# EasyEDA Pro project honglin-first_crt_smartphone-e4cb491d.epro, board 键盘
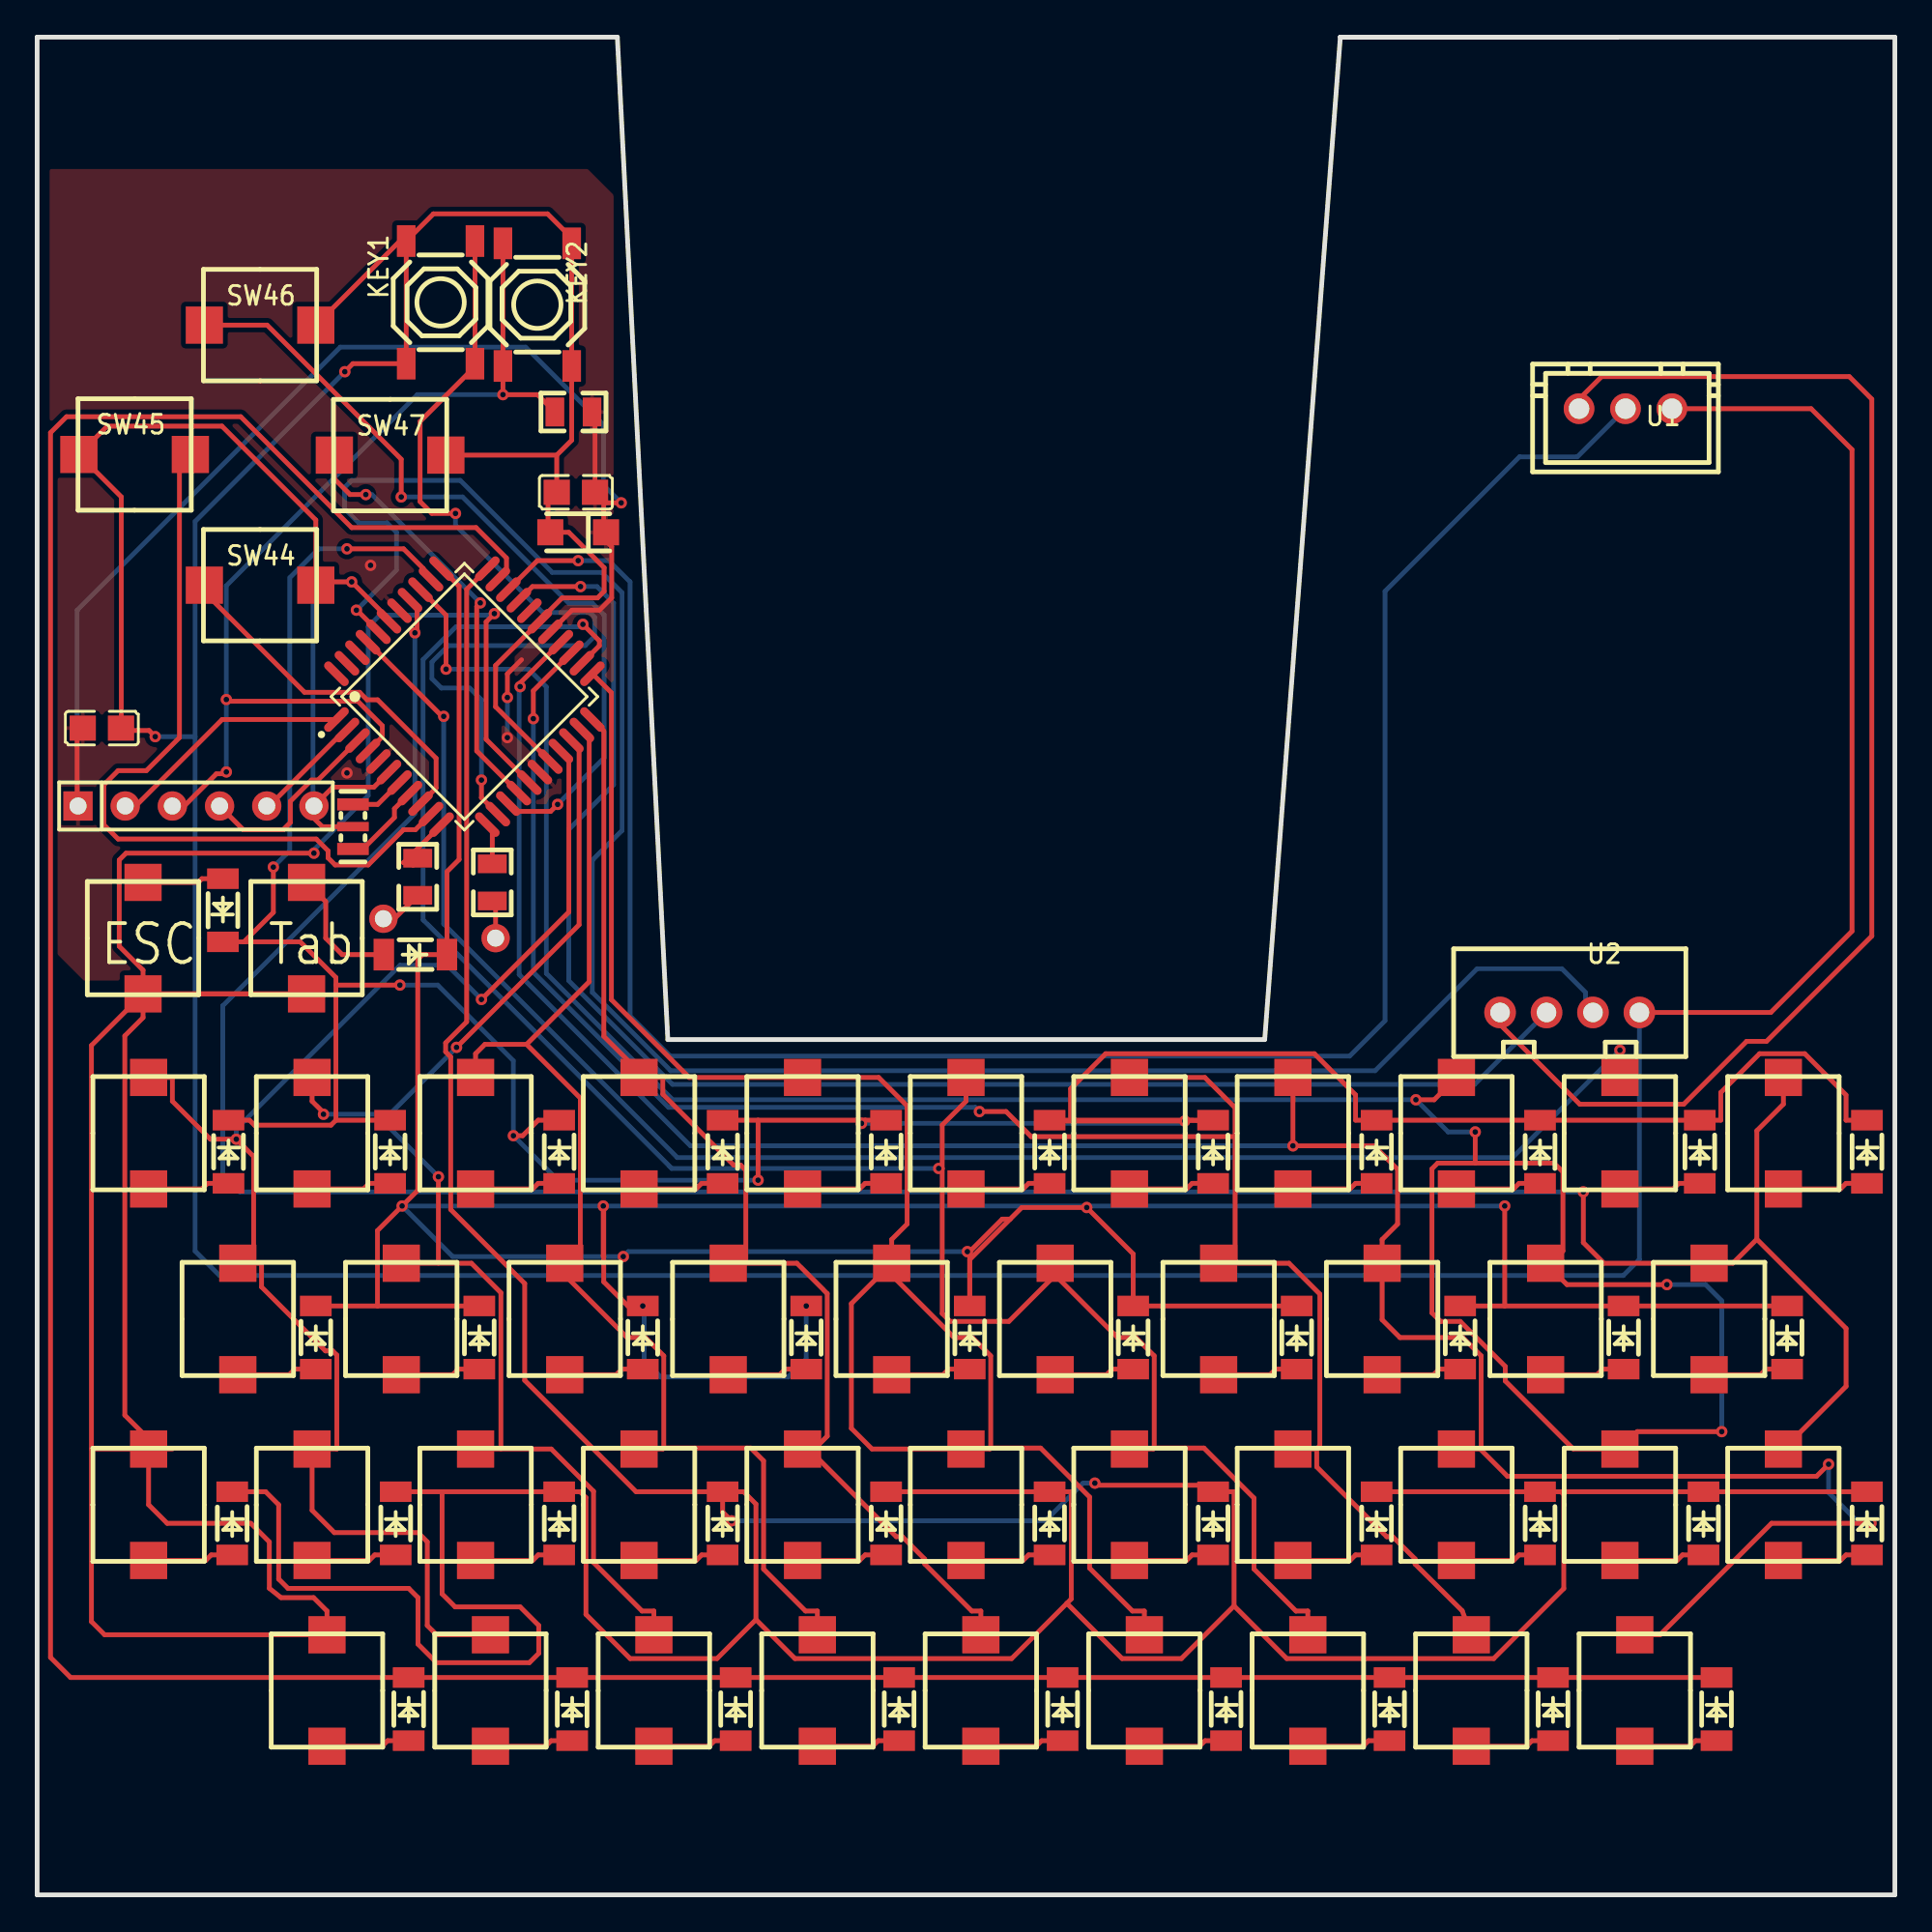
[diagram p9: board, top side]
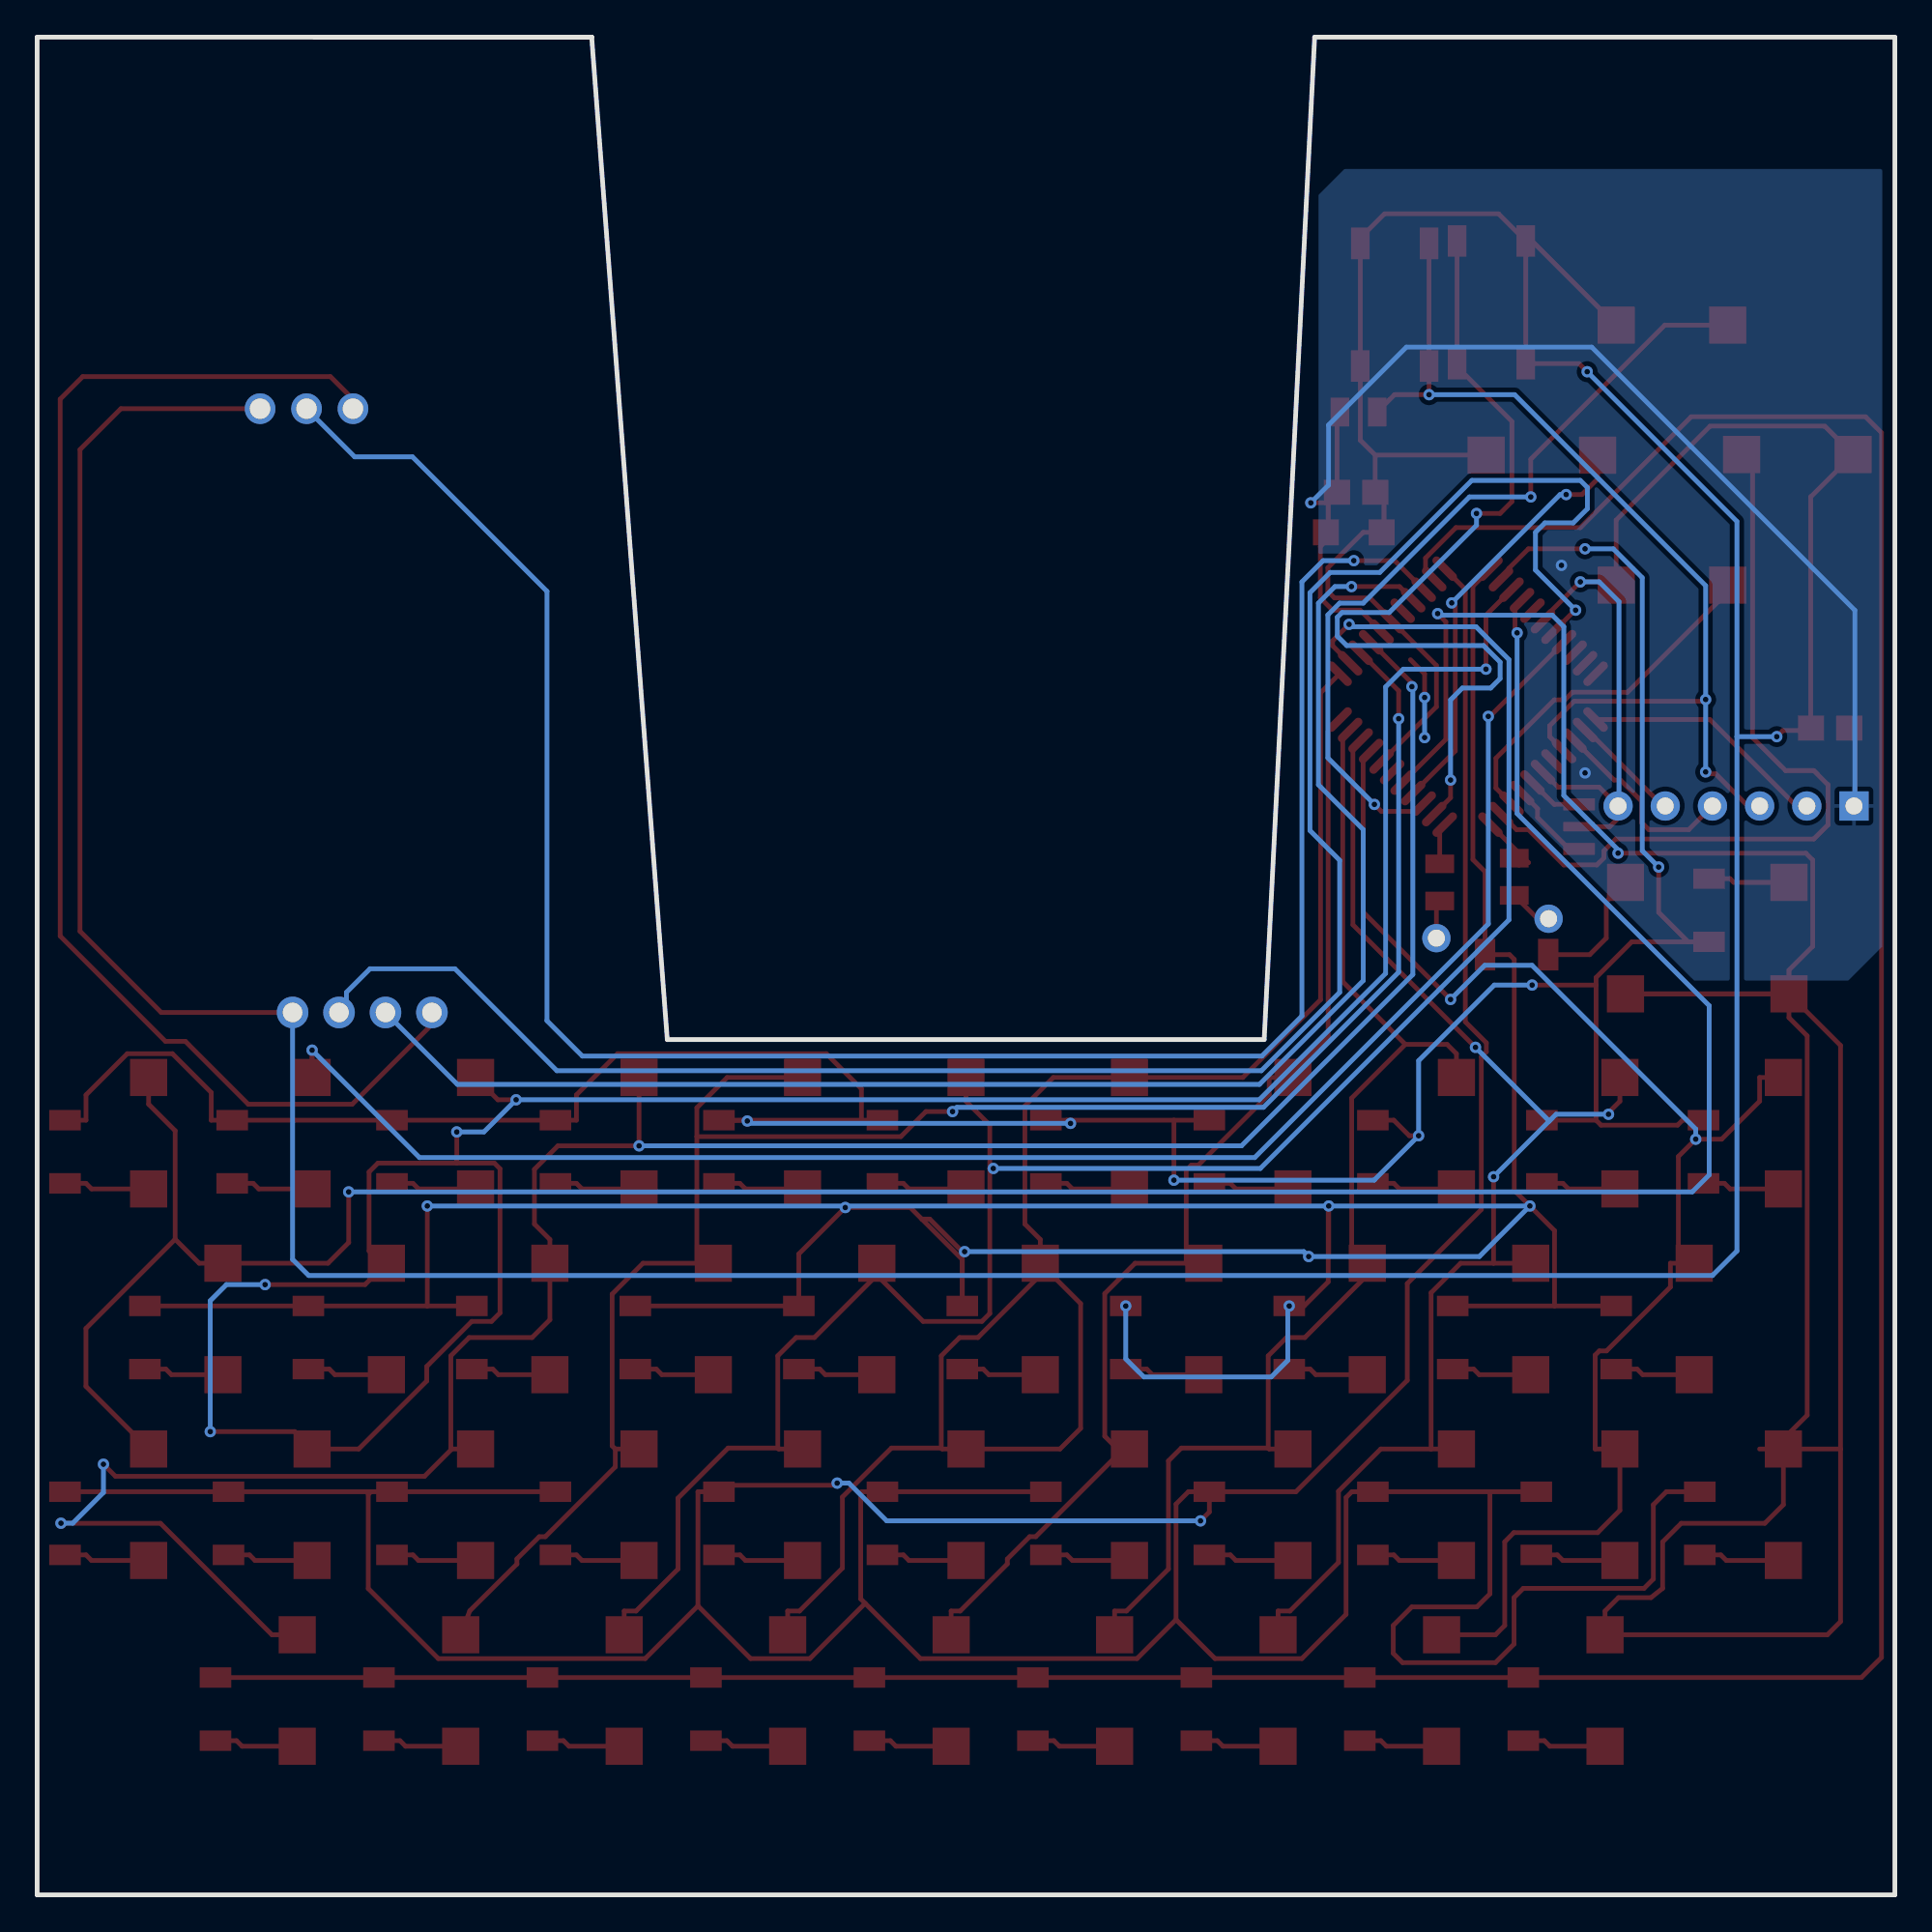
[diagram p10: board, bottom side, seen from below]

Outline 100 x 100 mm; copper layers: Top Layer, Bottom Layer. Coordinates in mm from the lower left corner of the outline.
Outline path: 70.15,100 66.08,46.04 33.95,46.04 31.23,100 0,100 0,0 100,0 100,100 70.15,100 ; 70.15,100 85.08,100 70.15,100
Stack: Top Layer 0.035mm / Dielectric1 1.51mm FR4 er 4.5 / Bottom Layer 0.035mm

## Design rules (mm)
spacing safeClearance (default): track to track 0.152, other pairs 0.152 to 0.3
spacing Plane_innerPlane: track to track 0.152, other pairs 0.152 to 0.3
spacing Copper_copperRegion: track to track 0.152, other pairs 0.152 to 0.3
track width trackWidth (default): min 0.127, default 0.254, max 2.54
differential pair differentialPair (default): width min 0.127, default 0.254, max 2.54; gap min 0.152, default 0.152
pour e943 uses Copper_copperRegion
pour e976 uses Copper_copperRegion

## Placement (name value [footprint] x y rotation side)
C10  4.7uF  [CAP-SMD_L3.2-W1.6-R-RD]  29.12 73.34 0 top
C11  0.1uF  [C0805]  3.48 62.8 180 top
C12  0.1uF  [C0805]  29 75.5 0 top
D1  1n4148  [LL-34_L3.5-W1.5-RD01]  10 53 90 top
D2  1n4148  [LL-34_L3.5-W1.5-RD01]  10.3 40 270 top
D3  1n4148  [LL-34_L3.5-W1.5-RD01]  19 40 270 top
D4  1n4148  [LL-34_L3.5-W1.5-RD01]  28.1 40 270 top
D5  1n4148  [LL-34_L3.5-W1.5-RD01]  36.9 40 270 top
D6  1n4148  [LL-34_L3.5-W1.5-RD01]  45.7 40 270 top
D7  1n4148  [LL-34_L3.5-W1.5-RD01]  54.5 40 270 top
D8  1n4148  [LL-34_L3.5-W1.5-RD01]  63.3 40 270 top
D9  1n4148  [LL-34_L3.5-W1.5-RD01]  72.1 40 270 top
D10  1n4148  [LL-34_L3.5-W1.5-RD01]  80.9 40 270 top
D11  1n4148  [LL-34_L3.5-W1.5-RD01]  20.36 50.61 180 top
D12  1n4148  [LL-34_L3.5-W1.5-RD01]  15 30 270 top
D13  1n4148  [LL-34_L3.5-W1.5-RD01]  23.8 30 270 top
D14  1n4148  [LL-34_L3.5-W1.5-RD01]  32.6 30 270 top
D15  1n4148  [LL-34_L3.5-W1.5-RD01]  41.4 30 270 top
D16  1n4148  [LL-34_L3.5-W1.5-RD01]  50.2 30 270 top
D17  1n4148  [LL-34_L3.5-W1.5-RD01]  59 30 270 top
D18  1n4148  [LL-34_L3.5-W1.5-RD01]  67.8 30 270 top
D19  1n4148  [LL-34_L3.5-W1.5-RD01]  76.6 30 270 top
D20  1n4148  [LL-34_L3.5-W1.5-RD01]  85.4 30 270 top
D21  1n4148  [LL-34_L3.5-W1.5-RD01]  10.5 20 270 top
D22  1n4148  [LL-34_L3.5-W1.5-RD01]  19.3 20 270 top
D23  1n4148  [LL-34_L3.5-W1.5-RD01]  28.1 20 270 top
D24  1n4148  [LL-34_L3.5-W1.5-RD01]  36.9 20 270 top
D25  1n4148  [LL-34_L3.5-W1.5-RD01]  45.7 20 270 top
D26  1n4148  [LL-34_L3.5-W1.5-RD01]  54.5 20 270 top
D27  1n4148  [LL-34_L3.5-W1.5-RD01]  63.3 20 270 top
D28  1n4148  [LL-34_L3.5-W1.5-RD01]  72.1 20 270 top
D29  1n4148  [LL-34_L3.5-W1.5-RD01]  80.9 20 270 top
D30  1n4148  [LL-34_L3.5-W1.5-RD01]  89.7 20 270 top
D31  1n4148  [LL-34_L3.5-W1.5-RD01]  20 10 270 top
D32  1n4148  [LL-34_L3.5-W1.5-RD01]  28.8 10 270 top
D33  1n4148  [LL-34_L3.5-W1.5-RD01]  37.6 10 270 top
D34  1n4148  [LL-34_L3.5-W1.5-RD01]  46.4 10 270 top
D35  1n4148  [LL-34_L3.5-W1.5-RD01]  55.2 10 270 top
D36  1n4148  [LL-34_L3.5-W1.5-RD01]  64 10 270 top
D37  1n4148  [LL-34_L3.5-W1.5-RD01]  72.8 10 270 top
D38  1n4148  [LL-34_L3.5-W1.5-RD01]  81.6 10 270 top
D39  1n4148  [LL-34_L3.5-W1.5-RD01]  90.4 10 270 top
D40  1n4148  [LL-34_L3.5-W1.5-RD01]  98.5 40 270 top
D41  1n4148  [LL-34_L3.5-W1.5-RD01]  94.2 30 270 top
D42  1n4148  [LL-34_L3.5-W1.5-RD01]  98.5 20 270 top
D43  1n4148  [LL-34_L3.5-W1.5-RD01]  89.5 40 270 top
IC1  ATMEGA32A-AU  [TQFP-44_L10.0-W10.0-P0.80-LS12.0-BL]  23 64.5 315 top
J3  Pin06  [PIN06]  8.55 58.61 90 top
KEY1  Key-4P  [SW-SMD_4P-L5.1-W5.1-P3.70-LS6.5-TL-2]  21.72 85.72 90 top
KEY2  Key-4P  [SW-SMD_4P-L5.1-W5.1-P3.70-LS6.5-TL-2]  26.92 85.6 270 top
NOREF  -  [Pad_e62]  18.64 52.54 0 top
NOREF#2  -  [Pad_e63]  24.68 51.5 0 top
R3  10K  [R0805]  28.87 79.82 0 top
R8  68R  [R0805]  20.49 54.8 90 top
R9  68R  [R0805]  24.5 54.5 90 top
SW1  KB01  [6*6*5硅胶开关]  5.7 51.5 270 top
SW2  KB01  [6*6*5硅胶开关]  6 41 90 top
SW3  KB01  [6*6*5硅胶开关]  14.8 41 90 top
SW4  KB01  [6*6*5硅胶开关]  23.6 41 90 top
SW5  KB01  [6*6*5硅胶开关]  32.4 41 90 top
SW6  KB01  [6*6*5硅胶开关]  41.2 41 90 top
SW7  KB01  [6*6*5硅胶开关]  50 41 90 top
SW8  KB01  [6*6*5硅胶开关]  58.8 41 90 top
SW9  KB01  [6*6*5硅胶开关]  67.6 41 90 top
SW10  KB01  [6*6*5硅胶开关]  76.4 41 90 top
SW11  KB01  [6*6*5硅胶开关]  14.5 51.5 270 top
SW12  KB01  [6*6*5硅胶开关]  10.8 31 90 top
SW13  KB01  [6*6*5硅胶开关]  19.6 31 90 top
SW14  KB01  [6*6*5硅胶开关]  28.4 31 90 top
SW15  KB01  [6*6*5硅胶开关]  37.2 31 90 top
SW16  KB01  [6*6*5硅胶开关]  46 31 90 top
SW17  KB01  [6*6*5硅胶开关]  54.8 31 90 top
SW18  KB01  [6*6*5硅胶开关]  63.6 31 90 top
SW19  KB01  [6*6*5硅胶开关]  72.4 31 90 top
SW20  KB01  [6*6*5硅胶开关]  81.2 31 90 top
SW21  KB01  [6*6*5硅胶开关]  6 21 90 top
SW22  KB01  [6*6*5硅胶开关]  14.8 21 90 top
SW23  KB01  [6*6*5硅胶开关]  23.6 21 90 top
SW24  KB01  [6*6*5硅胶开关]  32.4 21 90 top
SW25  KB01  [6*6*5硅胶开关]  41.2 21 90 top
SW26  KB01  [6*6*5硅胶开关]  50 21 90 top
SW27  KB01  [6*6*5硅胶开关]  58.8 21 90 top
SW28  KB01  [6*6*5硅胶开关]  67.6 21 90 top
SW29  KB01  [6*6*5硅胶开关]  76.4 21 90 top
SW30  KB01  [6*6*5硅胶开关]  85.2 21 90 top
SW31  KB01  [6*6*5硅胶开关]  15.6 11 90 top
SW32  KB01  [6*6*5硅胶开关]  24.4 11 90 top
SW33  KB01  [6*6*5硅胶开关]  33.2 11 90 top
SW34  KB01  [6*6*5硅胶开关]  42 11 90 top
SW35  KB01  [6*6*5硅胶开关]  50.8 11 90 top
SW36  KB01  [6*6*5硅胶开关]  59.6 11 90 top
SW37  KB01  [6*6*5硅胶开关]  68.4 11 90 top
SW38  KB01  [6*6*5硅胶开关]  77.2 11 90 top
SW39  KB01  [6*6*5硅胶开关]  86 11 90 top
SW40  KB01  [6*6*5硅胶开关]  85.2 41 90 top
SW41  KB01  [6*6*5硅胶开关]  94 41 90 top
SW42  KB01  [6*6*5硅胶开关]  90 31 90 top
SW43  KB01  [6*6*5硅胶开关]  94 21 90 top
SW44  KB01  [6*6*5硅胶开关]  12 70.5 0 top
SW45  KB01  [6*6*5硅胶开关]  5.25 77.54 180 top
SW46  KB01  [6*6*5硅胶开关]  12 84.5 0 top
SW47  KB01  [6*6*5硅胶开关]  19 77.5 0 top
U1  XH2.54-3P 直插  [CONN-TH_XH2.54-3P]  85.5 80 0 top
U2  XH2.54_4P_直插  [CONN-TH_4P-P2.50-XH2.54-4P]  82.5 47.5 180 top
X1  16MHz  [OSC-SMD_3P-L3.2-W1.3-P1.2-L]  17 57.5 90 top

## Footprints (pads in the part's own frame, mm; a bottom-side part is the same pattern mirrored in y, then rotated)
6*6*5硅胶开关
  rect 2x2 smd: 1(-3,0) 2(3,0)
C0805
  rect 1.41x1.35 smd: 1(-1.03,0) 2(1.03,0)
CAP-SMD_L3.2-W1.6-R-RD
  rect 1.4x1.4 smd: 1(1.5,0) 2(-1.5,0)
CONN-TH_4P-P2.50-XH2.54-4P
  round 1.7 hole 1.05: 1(3.75,0) 2(1.25,0) 3(-1.25,0) 4(-3.75,0)
CONN-TH_XH2.54-3P
  round 1.65 hole 1.1: 1(-2.5,0) 2(0,0) 3(2.5,0)
LL-34_L3.5-W1.5-RD01
  rect 1.1x1.7 smd: 1(1.7,0) 2(-1.7,0)
OSC-SMD_3P-L3.2-W1.3-P1.2-L
  rect 0.65x1.7 smd: 1(-1.2,0) 3(1.2,0)
  rect 0.5x1.7 smd: 2(0,0)
Pad_e62
  round 1.524 hole 0.914: 1(0,0)
Pad_e63
  round 1.524 hole 0.914: 1(0,0)
PIN06
  rect 1.575x1.575 hole 0.914: 1(0,6.35)
  round 1.575 hole 0.914: 2(0,3.81) 3(0,1.27) 4(0,-1.27) 5(0,-3.81) 6(0,-6.35)
R0805
  rect 1x1.55 smd: 1(-1,0) 2(1,0)
SW-SMD_4P-L5.1-W5.1-P3.70-LS6.5-TL-2
  rect 1.7x1 smd: 1(-3.3,1.849) 2(3.3,1.851) 3(-3.3,-1.851) 4(3.3,-1.851)
TQFP-44_L10.0-W10.0-P0.80-LS12.0-BL
  oval 0.448x1.684 smd: 1(-4,-5.742) 2(-3.2,-5.742) 3(-2.4,-5.742) 4(-1.6,-5.742) 5(-0.8,-5.742) 6(0,-5.742) 7(0.8,-5.742) 8(1.6,-5.742) 9(2.4,-5.742) 10(3.2,-5.742) 11(4,-5.742) 23(4,5.742) 24(3.2,5.742) 25(2.4,5.742) 26(1.6,5.742) 27(0.8,5.742) 28(0,5.742) 29(-0.8,5.742) 30(-1.6,5.742) 31(-2.4,5.742) 32(-3.2,5.742) 33(-4,5.742)
  oval 1.684x0.448 smd: 12(5.742,-4) 13(5.742,-3.2) 14(5.742,-2.4) 15(5.742,-1.6) 16(5.742,-0.8) 17(5.742,0) 18(5.742,0.8) 19(5.742,1.6) 20(5.742,2.4) 21(5.742,3.2) 22(5.742,4) 34(-5.742,4) 35(-5.742,3.2) 36(-5.742,2.4) 37(-5.742,1.6) 38(-5.742,0.8) 39(-5.742,0) 40(-5.742,-0.8) 41(-5.742,-1.6) 42(-5.742,-2.4) 43(-5.742,-3.2) 44(-5.742,-4)

## Nets
GND: C10.2 C11.1 C12.1 IC1.6 IC1.18 IC1.28 IC1.39 J3.6 KEY1.1 KEY1.2 KEY2.1 KEY2.2 SW44.2 SW45.2 SW46.2 SW47.2 U1.3 U2.4 X1.2
VCC: C10.1 C11.2 C12.2 IC1.5 IC1.17 IC1.27 IC1.38 J3.1 R3.2
B1: IC1.40 U2.3
BLDO2: U1.1 U2.1
COL1: IC1.9 SW44.1
COL2: IC1.10 SW45.1
COL3: IC1.14 SW46.1
COL4: IC1.15 SW47.1
COL5: IC1.16 SW1.2 SW11.2 SW21.2 SW31.2
COL6: IC1.19 SW2.2 SW12.2 SW22.2 SW32.2
COL7: IC1.20 SW3.2 SW13.2 SW23.2 SW33.2
COL8: IC1.21 SW4.2 SW14.2 SW24.2 SW34.2
COL9: IC1.22 SW5.2 SW15.2 SW25.2 SW35.2
COL10: IC1.23 SW6.2 SW16.2 SW26.2 SW36.2
COL11: IC1.24 SW7.2 SW17.2 SW27.2 SW37.2
COL12: IC1.25 SW8.2 SW18.2 SW28.2 SW38.2
COL13: IC1.26 SW9.2 SW19.2 SW29.2 SW39.2
COL14: IC1.36 SW10.2 SW20.2 SW30.2
COL15: IC1.37 SW41.2 SW42.2 SW43.2
COL16: IC1.41 SW40.2
D+: IC1.11 R8.2
D-: IC1.12 R9.2
MISO: IC1.2 J3.5
MOSI: IC1.1 J3.2
PRX: IC1.30 U2.2
PRY: IC1.31 U1.2
ROW1: D1.2 D2.2 D3.2 D4.2 D5.2 D6.2 D7.2 D8.2 D9.2 D10.2 D40.2 D43.2 IC1.35
ROW2: D11.2 D12.2 D13.2 D14.2 D15.2 D16.2 D17.2 D18.2 D19.2 D20.2 D41.2 IC1.34
ROW3: D21.2 D22.2 D23.2 D24.2 D25.2 D26.2 D27.2 D28.2 D29.2 D30.2 D42.2 IC1.33
ROW4: D31.2 D32.2 D33.2 D34.2 D35.2 D36.2 D37.2 D38.2 D39.2 IC1.32
RST: IC1.4 J3.3 KEY2.3 KEY2.4 R3.1
SCK: IC1.3 J3.4
USB_KEYBOARD_D+: NOREF.1 R8.1
USB_KEYBOARD_D-: NOREF#2.1 R9.1
$2N1011: IC1.8 X1.1
$2N1012: IC1.7 X1.3
$2N1154: IC1.13 KEY1.3 KEY1.4
$2N1512: D1.1 SW1.1
$2N1513: D2.1 SW2.1
$2N1514: D3.1 SW3.1
$2N1515: D4.1 SW4.1
$2N1516: D5.1 SW5.1
$2N1517: D6.1 SW6.1
$2N1518: D7.1 SW7.1
$2N1519: D8.1 SW8.1
$2N1520: D9.1 SW9.1
$2N1521: D10.1 SW10.1
$2N1522: D11.1 SW11.1
$2N1523: D12.1 SW12.1
$2N1524: D13.1 SW13.1
$2N1525: D14.1 SW14.1
$2N1526: D15.1 SW15.1
$2N1527: D16.1 SW16.1
$2N1528: D17.1 SW17.1
$2N1529: D18.1 SW18.1
$2N1530: D19.1 SW19.1
$2N1531: D20.1 SW20.1
$2N1532: D21.1 SW21.1
$2N1533: D22.1 SW22.1
$2N1534: D23.1 SW23.1
$2N1535: D24.1 SW24.1
$2N1536: D25.1 SW25.1
$2N1537: D26.1 SW26.1
$2N1538: D27.1 SW27.1
$2N1539: D28.1 SW28.1
$2N1540: D29.1 SW29.1
$2N1541: D30.1 SW30.1
$2N1542: D31.1 SW31.1
$2N1543: D32.1 SW32.1
$2N1544: D33.1 SW33.1
$2N1545: D34.1 SW34.1
$2N1546: D35.1 SW35.1
$2N1547: D36.1 SW36.1
$2N1548: D37.1 SW37.1
$2N1549: D38.1 SW38.1
$2N1550: D39.1 SW39.1
$2N1551: D40.1 SW41.1
$2N1552: D41.1 SW42.1
$2N1553: D42.1 SW43.1
$2N1554: D43.1 SW40.1

Pads without a net: IC1 29 42 43 44

## Via types
v1: diameter 0.61, hole 0.305, Top Layer to Bottom Layer, 61 vias

## Routing (per net, layer and track width the routed paths; a pad name or vN(x,y) marks a point on that pad's centre or on a via; arc(x,y) is an arc through that point)
GND: length 326
  Top Layer w0.254: 27.97,77.5 C12.1 27.5,75.03 27.5,73 ; 27.97,77.5 28.77,78.3 KEY2.2 ; 27.97,77.5 SW47.2 ; 19.87,89.02 KEY1.1 17,82.42 v1(16.56,81.99) ; X1.2 15.35,57.5 14.85,58 ; v1(6.36,62.35) 6.03,62.68 4.53,62.68 4.53,75.25 SW45.2 3.77,79.06 9.95,79.06 15,74.01 SW44.2 15.18,70.68 v1(16.93,70.68) 18.94,68.67 18.94,68.56 ; 28.77,82.3 28.77,89.19 27.47,90.49 21.33,90.49 KEY1.2 19.53,89.02 SW46.2 ; IC1.18 24.68,63.95 24.68,66.18 27.06,68.56 27.06,68.61 28.26,69.81 30.16,69.81 30.52,70.17 30.52,71.44 28.61,73.34 C10.2 ; U2.4 93.32,47.5 97.69,51.87 97.69,77.8 95.49,80 U1.3 ; IC1.6 18.13,59.63 15.92,59.63 J3.6
  Bottom Layer w0.254: 14.85,58 14.85,69.61 15.92,70.68 v1(16.93,70.68) ; v1(16.56,81.99) 8.5,73.93 8.5,62.35 ; 8.5,62.35 v1(6.36,62.35) ; 8.5,62.35 8.5,34.66 9.82,33.34 85.38,33.34 86.25,34.21 U2.4
VCC: length 76.7
  Top Layer w0.254: v1(25.31,64.45) 25.31,65.72 26.08,66.49 ; IC1.27 28.79,69.15 30.27,69.15 30.93,69.81 30.93,72.57 30.5,73 30.5,74.93 ; R3.2 30.03,79.66 C12.2 30.03,75.4 30.5,74.93 ; 30.5,74.93 v1(31.44,74.93) ; 2.15,58 2.15,62.63 2.47,62.95
  Bottom Layer w0.254: v1(25.31,62.3) v1(25.31,64.45) ; 2.15,58 2.15,69.15 16.32,83.31 26.29,83.31 30.48,79.12 30.48,75.89 v1(31.44,74.93)
  vias: v1(16.68,60.39) v1(17.95,71.57)
B1: length 110.2
  Top Layer w0.254: IC1.40 17.21,69.15 v1(17.19,69.15)
  Bottom Layer w0.254: U2.3 83.35,47.9 83.35,48.58 82.08,49.85 77.51,49.85 72.02,44.36 34.1,44.36 29.89,48.58 29.89,55.69 31.48,57.29 31.48,70.09 30.39,71.19 27.73,71.19 22.77,76.14 16.93,76.14 16.55,75.76 16.55,74.61 17.31,73.85 18.84,73.85 19.34,73.34 19.34,71.31 v1(17.19,69.15)
BLDO2: length 72.4
  Top Layer w0.254: U1.1 83,80.51 84.21,81.73 97.55,81.73 98.76,80.51 98.76,51.61 93.09,45.94 92.02,45.94 88.63,42.56 83.04,42.56 78.75,46.85 U2.1
COL1: length 19.3
  Top Layer w0.254: SW44.1 9,70.13 14.39,64.73 17.35,64.73 17.76,64.33 18.33,64.33 21.48,61.18 21.48,59.58 IC1.9
COL2: length 42.6
  Top Layer w0.254: IC1.10 20.36,57.34 19.72,57.34 17.82,55.44 16.04,55.44 15.66,55.82 15.66,56.2 15.03,56.83 4.36,56.83 3.6,57.6 3.6,59.76 4.36,60.52 5.88,60.52 7.66,62.3 7.66,76.95 SW45.1
COL3: length 43.4
  Top Layer w0.254: IC1.14 25.78,58.32 27.64,58.32 v1(28.02,58.7) ; v1(19.6,75.25) 19.6,77.28 12.38,84.5 SW46.1
  Bottom Layer w0.254: v1(19.6,75.25) 22.9,75.25 28.61,69.53 29.89,69.53 30.52,68.9 30.52,61.2 v1(28.02,58.7)
COL4: length 23.2
  Top Layer w0.254: v1(23.86,69.54) 23.66,69.35 23.66,61.58 IC1.15 ; SW47.1 16,76.22 16.84,75.38 v1(17.69,75.38)
  Bottom Layer w0.254: v1(23.86,69.54) 18.02,75.38 v1(17.69,75.38)
COL5: length 162.3
  Top Layer w0.254: SW1.2 SW11.2 SW1.2 ; SW1.2 2.92,45.72 2.92,24 ; SW1.2 5.7,47.22 4.72,46.24 4.72,25.82 6.54,24 ; SW1.2 5.7,49.78 4.42,51.06 4.42,55.71 4.79,56.07 v1(14.9,56.07) ; 6.54,24 7.28,24 ; 6.54,24 6,24 ; v1(24.61,68.97) 24.17,68.53 24.17,62.2 IC1.16 ; 6,24 2.92,24 ; 6,24 6,21 7,20 11.5,20 12.5,19 12.5,16.5 13.13,16 14.88,16 15.6,15.28 15.6,14 ; SW31.2 3.63,14 2.92,14.71 2.92,24
  Bottom Layer w0.254: v1(24.61,68.97) 24.53,68.89 18.44,68.89 17.82,68.26 17.82,59.18 14.9,56.26 v1(14.9,56.07)
COL6: length 80.4
  Top Layer w0.254: v1(23.92,48.2) 28.62,52.9 28.62,61.14 IC1.19 ; 24.4,14 21.5,14 21,14.5 21,19 20.51,19.5 16,19.5 14.8,20.7 14.8,24 16.13,24 16.13,29.06 15.91,29.28 15.52,29.28 12.08,32.72 12.08,34 11.65,34 ; SW2.2 7.28,44 7.28,42.72 9.32,40.68 v1(10.72,40.68) 11.65,39.74 11.65,34 ; 11.65,34 SW12.2
  Bottom Layer w0.254: v1(23.92,48.2) 22.08,50.04 19.53,50.04 10.72,41.23 v1(10.72,40.68)
COL7: length 70.7
  Top Layer w0.254: 24.96,24 24.96,32.41 23.37,34 21.6,34 ; 24.96,24 27.68,24 29.95,21.73 29.95,17.89 32.56,15.28 33.2,15.28 SW33.2 ; 24.96,24 23.6,24 ; 21.6,34 v1(21.6,38.65) ; 21.6,34 SW13.2 ; v1(15.41,42.02) 15.41,42.11 14.8,42.72 SW3.2 ; IC1.20 29.17,61.72 29.17,52.22 v1(22.58,45.62)
  Bottom Layer w0.254: 18.6,41.65 v1(22.58,45.62) ; 18.6,41.65 v1(21.6,38.65) ; 18.6,41.65 18.24,42.02 v1(15.41,42.02)
COL8: length 67
  Top Layer w0.254: 33.73,24.05 38.41,24.05 39.1,23.36 39.1,17.54 41.36,15.28 42,15.28 SW34.2 ; 33.73,24.05 33.68,24 32.4,24 ; 33.73,24.05 33.73,29.01 32.75,30 31.76,30 28.4,33.36 28.4,33.68 ; SW14.2 28.4,33.68 ; 28.4,33.68 29.24,34.52 29.24,42.89 26.35,45.78 ; 26.35,45.78 29.72,49.15 29.72,62.31 IC1.21 ; 26.35,45.78 24.1,45.78 23.6,45.28 SW4.2
COL9: length 63.4
  Top Layer w0.254: 32.72,44 33.68,44 33.68,43.1 37.5,39.28 37.87,39.28 38.15,39 38.15,34 ; 32.72,44 30.51,46.21 30.51,62.65 29.89,63.27 ; 32.72,44 SW5.2 ; 38.15,34 40.9,34 42.53,32.37 42.53,24.69 41.84,24 ; 38.15,34 SW15.2 ; 41.84,24 41.7,23.86 41.7,23.83 46.25,19.28 46.57,19.28 47.78,18.08 47.78,17.81 50.31,15.28 50.8,15.28 SW35.2 ; 41.84,24 41.2,24
COL10: length 91
  Top Layer w0.254: 51.33,24.05 51.28,24 44.94,24 43.83,25.11 43.83,31.83 SW16.2 ; 51.33,24.05 54.02,24.05 56.65,21.41 56.65,17.59 58.96,15.28 59.6,15.28 SW36.2 ; 51.33,24.05 51.33,29.01 50.35,30 49.36,30 46,33.36 SW16.2 ; IC1.23 30.91,64.71 30.91,48.19 35.1,44 SW6.2 45.3,44 46.83,42.47 46.83,36.11 46,35.28 SW16.2
COL11: length 109.8
  Top Layer w0.254: SW7.2 50,42.72 48.72,41.44 48.72,39.1 ; 58.8,24 60.08,24 60.13,24.05 ; v1(29.38,68.39) 30.27,67.5 30.27,67.24 IC1.24 ; 48.72,39.1 v1(48.53,39.1) ; 48.72,39.1 48.72,31.29 49.14,30.87 52.31,30.87 54.8,33.36 ; 54.8,33.36 SW17.2 ; 54.8,33.36 58.16,30 59.15,30 60.13,29.01 60.13,24.05 ; 60.13,24.05 62.81,24.05 65.5,21.36 65.5,17.54 67.76,15.28 68.4,15.28 SW37.2
  Bottom Layer w0.254: v1(48.53,39.1) 34.16,39.1 20.77,52.48 20.77,66.49 22.55,68.26 29.25,68.26 v1(29.38,68.39)
COL12: length 103.6
  Top Layer w0.254: 68.88,24 68.88,23.04 72.65,19.28 72.97,19.28 74.17,18.08 74.17,17.81 76.71,15.29 SW38.2 ; 68.88,24 67.6,24 ; 68.88,24 68.88,24 ; 68.88,24 69.05,24.17 69.05,32.34 67.39,34 64.49,34 ; IC1.25 26.71,64.82 v1(26.71,63.31) ; v1(50.72,42.16) 52.16,42.16 53.51,40.82 64.49,40.82 ; 64.49,34 SW18.2 ; 64.49,34 64.49,40.82 ; SW8.2 62.85,44 64.49,42.37 64.49,40.82
  Bottom Layer w0.254: v1(50.72,42.16) 50.5,42.39 33.99,42.39 26.71,49.67 v1(26.71,63.31)
COL13: length 134.4
  Top Layer w0.254: 76.4,24 77.68,24 ; 77.68,24 77.73,24.05 77.73,29.01 76.75,30 73.36,30 72.4,30.96 SW19.2 72.4,35.28 73.23,36.11 73.23,39.06 71.97,40.32 v1(67.6,40.32) SW9.2 ; 77.68,24 79.15,22.53 95.78,22.53 v1(96.43,23.18) ; v1(98.72,20) 98.75,20 98.76,20 93.36,20 87.36,14 SW39.2 ; IC1.26 26,65.23 v1(26,65.04)
  Bottom Layer w0.254: v1(96.43,23.18) 96.43,21.66 98.08,20 v1(98.72,20) ; v1(26,65.04) 25.95,64.99 25.95,49.54 35.17,40.32 v1(67.6,40.32)
COL14: length 141.4
  Top Layer w0.254: 77.41,39.39 81.66,39.39 82.13,38.91 82.13,34.66 81.47,34 SW20.2 82.35,32.85 v1(87.73,32.85) ; 77.41,39.39 v1(77.41,41.07) ; 77.41,39.39 75.39,39.39 75.08,39.08 75.08,31.33 75.54,30.87 76.6,30.87 79.03,28.44 79.03,27.66 82.69,24 85.2,24 86.14,24.94 v1(90.68,24.94) ; IC1.36 22.01,68.88 v1(22.01,65.98) ; v1(74.22,42.8) 75.2,42.8 SW10.2
  Bottom Layer w0.254: v1(87.73,32.85) 89.81,32.85 90.68,31.98 v1(90.68,24.94) ; v1(22.01,65.98) 26.46,65.98 27.41,65.02 27.41,49.6 34.21,42.8 v1(74.22,42.8) 75.95,41.07 v1(77.41,41.07)
COL15: length 146.1
  Top Layer w0.254: SW41.2 94,42.56 92.57,41.13 92.57,35.29 ; 92.57,35.29 97.38,30.49 97.38,27.37 94,24 ; 92.57,35.29 91.28,34 SW42.2 84.34,34 83.23,35.11 v1(83.23,37.84) ; v1(20.33,67.93) 20.45,68.05 20.45,69.31 IC1.37
  Bottom Layer w0.254: v1(83.23,37.84) 10.91,37.84 10,38.75 10,47.87 20.33,58.21 v1(20.33,67.93)
COL16: length 90.8
  Top Layer w0.254: IC1.41 21.8,63.44 v1(21.88,63.44) ; v1(85.2,45.47) SW40.2 v1(85.2,45.47)
  Bottom Layer w0.254: v1(21.88,63.44) 21.88,52.26 34.46,39.69 79.42,39.69 v1(85.2,45.47)
D+: length 3.5
  Top Layer w0.254: IC1.11 19.72,55.56 20.09,55.56 20.23,55.42
D-: length 2.2
  Top Layer w0.254: IC1.12 24.5,57.34 R9.2
MISO: length 6.6
  Top Layer w0.254: 16.68,62.7 16.58,62.7 12.31,58.44 12.31,58
MOSI: length 13.6
  Top Layer w0.254: 4.69,58 9.96,63.27 16.11,63.27
PRX: length 83.6
  Top Layer w0.254: v1(29.25,70.42) 26.66,70.42 IC1.30
  Bottom Layer w0.254: v1(29.25,70.42) 30.14,70.42 31.03,69.53 31.03,59.76 28.61,57.34 28.61,49.21 34.2,43.63 77.38,43.63 U2.2
PRY: length 113.5
  Top Layer w0.254: v1(29.12,71.82) 26.93,71.82 IC1.31
  Bottom Layer w0.254: v1(29.12,71.82) 30.77,71.82 31.92,70.68 31.92,47.31 34.08,45.15 70.65,45.15 72.56,47.06 72.56,70.17 79.8,77.41 82.91,77.41 U1.2
ROW1: length 184.9
  Top Layer w0.254: D6.2 44.57,41.7 ; 44.57,41.7 38.81,41.7 ; 44.57,41.7 44.4,41.53 v1(44.37,41.53) ; D40.2 97.37,41.7 97.37,43.06 95.15,45.28 92.72,45.28 90.63,43.19 90.63,41.7 D43.2 D10.2 D9.2 70.97,41.7 70.97,43.06 68.75,45.28 57.52,45.28 55.63,43.39 55.63,41.7 ; v1(25.64,40.86) 26.14,40.86 26.97,41.7 D4.2 ; 55.63,41.7 D7.2 54.54,41.66 v1(61.77,41.66) ; 55.63,41.7 61.77,41.7 ; 38.81,41.7 D5.2 ; 38.81,41.7 v1(38.81,38.47) ; v1(16.68,72.46) 19.73,72.46 20.78,71.4 20.78,71.24 IC1.35 ; D3.2 16.08,41.7 ; 16.08,41.7 15.82,41.43 11.7,41.43 11.43,41.7 D2.2 ; 16.08,41.7 16.08,48.97 ; D8.2 63.21,41.7 ; 63.21,41.7 61.77,41.7 ; 63.21,41.7 63.17,41.66 61.77,41.7 ; 16.08,48.97 v1(19.53,48.97) ; 16.08,48.97 16.08,49.38 14.16,51.3 11.13,51.3 ; v1(12.71,55.33) 12.71,52.88 11.13,51.3 ; D1.2 11.13,51.3
  Bottom Layer w0.254: v1(12.71,55.33) 13.6,56.21 13.6,70.9 15.15,72.46 v1(16.68,72.46) ; v1(44.37,41.53) 61.65,41.53 v1(61.77,41.66) ; v1(19.53,48.97) 21.56,48.97 25.64,44.9 v1(25.64,40.86) 28.03,38.47 v1(38.81,38.47)
ROW2: length 221.2
  Top Layer w0.254: 79,31.7 D19.2 ; 79,31.7 D20.2 D41.2 ; 79,31.7 v1(79,37.08) ; D13.2 18.32,31.7 ; 18.32,31.7 18.32,35.76 v1(19.65,37.08) 20.49,37.92 20.49,50.36 20.74,50.61 D11.2 22.06,55.08 22.71,55.73 22.71,70.44 IC1.34 ; 18.32,31.7 D12.2 ; 52.37,36.37 50.2,34.2 D16.2 50.2,34.62 ; 52.37,36.37 51.95,36.37 50.2,34.62 ; 52.37,36.37 53,37 v1(56.5,37) 59,34.5 D17.2 D18.2 ; v1(50.08,34.62) 50.2,34.62 ; 30.5,34.36 30.5,33 31.8,31.7 v1(32.6,31.7) ; 30.5,34.36 30.47,34.39 v1(30.47,37.08) ; 30.5,34.36 30.5,37
  Bottom Layer w0.254: v1(41.4,31.7) 41.4,28.85 40.43,27.88 33.57,27.88 32.68,28.77 32.68,31.69 ; v1(79,37.08) v1(30.47,37.08) 19.65,37.08 22.37,34.36 v1(31.55,34.36) 31.82,34.62 v1(50.08,34.62)
ROW3: length 267
  Top Layer w0.254: 55.43,15.69 58.4,12.72 61.59,12.72 64.43,15.55 ; 55.43,15.69 55.67,15.93 55.67,21.66 55.63,21.7 D26.2 D25.2 ; 55.43,15.69 52.45,12.72 40.79,12.72 38.69,14.82 ; D24.2 32.24,21.7 26.25,27.69 26.25,32.91 22.26,36.89 22.26,45.11 21.99,45.38 21.99,45.86 23.12,46.99 23.12,70.28 IC1.33 ; D24.2 36.9,20.61 v1(37.38,20.13) ; D24.2 38.03,21.7 38.69,21.03 38.69,14.82 ; 21.8,21.7 D23.2 29.23,21.7 29.54,21.39 29.54,15.1 31.92,12.72 36.6,12.72 38.69,14.82 ; 21.8,21.7 D22.2 ; 21.8,21.7 21.8,16.2 22.5,15.5 26,15.5 27,14.5 27,13 26.5,12.5 21.5,12.5 20.5,13.5 20.5,16 20,16.5 13.5,16.5 13,17 13,21 12.3,21.7 D21.2 ; D28.2 D29.2 82.03,21.7 ; 57.05,22.05 62.95,22.05 D27.2 64.43,21.7 ; 82.03,21.7 82.18,21.55 82.18,16.49 78.41,12.72 67.27,12.72 64.43,15.55 ; 82.03,21.7 D30.2 D42.2 ; 64.43,21.7 64.43,15.55
  Bottom Layer w0.254: v1(37.38,20.13) 54.27,20.13 56.3,22.16 v1(56.94,22.16)
ROW4: length 185.4
  Top Layer w0.254: IC1.32 25.26,71.29 25.26,71.96 23.62,73.6 16.93,73.6 10.96,79.57 1.58,79.57 0.72,78.71 0.72,12.78 1.8,11.7 D31.2 D32.2 D33.2 D34.2 D35.2 D36.2 D37.2 D38.2 D39.2
RST: length 55
  Top Layer w0.254: 25.07,88.9 KEY2.4 v1(25.07,80.76) 26.94,80.76 27.87,79.82 ; 7.23,58 7.3,58 9.65,60.35 10.09,60.35 v1(10.18,60.45) ; 10.28,64.25 17.26,64.25 18.58,62.93 18.58,62.34 IC1.4
  Bottom Layer w0.254: v1(25.07,80.76) 20.47,80.76 10.18,70.47 v1(10.18,64.34) v1(10.18,60.45)
SCK: length 10.6
  Top Layer w0.254: J3.4 11.09,57.34 13.25,57.34 13.63,57.72 13.63,58.87 14.77,60.01 15.12,60.01 17.24,62.14
USB_KEYBOARD_D+: length 2.4
  Top Layer w0.254: R8.1 19.23,52.54 NOREF.1
USB_KEYBOARD_D-: length 2.1
  Top Layer w0.254: NOREF#2.1 24.68,53.32 R9.1
$2N1011: length 4.6
  Top Layer w0.254: X1.1 17.54,56.3 19.23,57.99 19.23,58.47 IC1.8
$2N1012: length 3
  Top Layer w0.254: X1.3 18.33,58.7 IC1.7
$2N1154: length 48.5
  Top Layer w0.254: v1(22.52,74.36) 21.25,74.36 20.61,75 20.61,79.31 23.57,82.27 KEY1.3 KEY1.4 ; v1(23.92,60.01) 23.92,59.06 IC1.13
  Bottom Layer w0.254: v1(23.92,60.01) 23.92,64.33 23.28,64.96 21.76,64.96 21.25,65.47 21.25,66.36 22.14,67.25 29.5,67.25 30.01,67.76 30.01,68.77 29.76,69.03 27.22,69.03 22.52,73.73 v1(22.52,74.36)
$2N1512: length 4.4
  Top Layer w0.254: D1.1 8.87,54.7 8.67,54.5 SW1.1
$2N1513: length 4.4
  Top Layer w0.254: D2.1 9.17,38.3 8.87,38 SW2.1
$2N1514: length 4.3
  Top Layer w0.254: SW3.1 17.57,38 17.87,38.3 D3.1
$2N1515: length 4.6
  Top Layer w0.254: D4.1 26.97,38.3 26.67,38 SW4.1
$2N1516: length 4.6
  Top Layer w0.254: SW5.1 35.47,38 35.77,38.3 D5.1
$2N1517: length 4.6
  Top Layer w0.254: D6.1 44.57,38.3 44.27,38 SW6.1
$2N1518: length 4.6
  Top Layer w0.254: SW7.1 53.07,38 53.37,38.3 D7.1
$2N1519: length 4.6
  Top Layer w0.254: D8.1 62.17,38.3 61.87,38 SW8.1
$2N1520: length 4.6
  Top Layer w0.254: SW9.1 70.67,38 70.97,38.3 D9.1
$2N1521: length 4.6
  Top Layer w0.254: D10.1 79.77,38.3 79.47,38 SW10.1
$2N1522: length 6.9
  Top Layer w0.254: D11.1 16.42,50.61 15.53,51.5 15.53,53.47 SW11.1
$2N1523: length 4.3
  Top Layer w0.254: SW12.1 13.57,28 13.87,28.3 D12.1
$2N1524: length 4.3
  Top Layer w0.254: D13.1 22.67,28.3 22.37,28 SW13.1
$2N1525: length 4.3
  Top Layer w0.254: D14.1 31.47,28.3 31.17,28 SW14.1
$2N1526: length 4.3
  Top Layer w0.254: D15.1 40.27,28.3 39.97,28 SW15.1
$2N1527: length 4.3
  Top Layer w0.254: D16.1 49.07,28.3 48.77,28 SW16.1
$2N1528: length 4.3
  Top Layer w0.254: SW17.1 57.57,28 57.87,28.3 D17.1
$2N1529: length 4.3
  Top Layer w0.254: D18.1 66.67,28.3 66.37,28 SW18.1
$2N1530: length 4.3
  Top Layer w0.254: D19.1 75.47,28.3 75.17,28 SW19.1
$2N1531: length 4.3
  Top Layer w0.254: SW20.1 83.97,28 84.27,28.3 D20.1
$2N1532: length 4.6
  Top Layer w0.254: 10.5,18.3 9.37,18.3 9.07,18 SW21.1
$2N1533: length 4.6
  Top Layer w0.254: 19.3,18.3 18.17,18.3 17.87,18 SW22.1
$2N1534: length 4.6
  Top Layer w0.254: 28.1,18.3 26.97,18.3 26.67,18 SW23.1
$2N1535: length 4.6
  Top Layer w0.254: 36.9,18.3 35.77,18.3 35.47,18 SW24.1
$2N1536: length 4.6
  Top Layer w0.254: SW25.1 44.27,18 44.57,18.3 45.7,18.3
$2N1537: length 4.6
  Top Layer w0.254: 54.5,18.3 53.37,18.3 53.07,18 SW26.1
$2N1538: length 4.6
  Top Layer w0.254: 63.3,18.3 62.17,18.3 61.87,18 SW27.1
$2N1539: length 4.6
  Top Layer w0.254: 72.1,18.3 70.97,18.3 70.67,18 SW28.1
$2N1540: length 4.6
  Top Layer w0.254: 80.9,18.3 79.77,18.3 79.47,18 SW29.1
$2N1541: length 4.6
  Top Layer w0.254: 89.7,18.3 88.57,18.3 88.27,18 SW30.1
$2N1542: length 4.5
  Top Layer w0.254: SW31.1 18.57,8 18.87,8.3 20,8.3
$2N1543: length 4.5
  Top Layer w0.254: SW32.1 27.37,8 27.67,8.3 28.8,8.3
$2N1544: length 4.5
  Top Layer w0.254: 37.6,8.3 36.47,8.3 36.17,8 SW33.1
$2N1545: length 4.5
  Top Layer w0.254: 46.4,8.3 45.27,8.3 44.97,8 SW34.1
$2N1546: length 4.5
  Top Layer w0.254: SW35.1 53.77,8 54.07,8.3 55.2,8.3
$2N1547: length 4.5
  Top Layer w0.254: SW36.1 62.57,8 62.87,8.3 64,8.3
$2N1548: length 4.5
  Top Layer w0.254: 72.8,8.3 71.67,8.3 71.37,8 SW37.1
$2N1549: length 4.5
  Top Layer w0.254: SW38.1 80.17,8 80.47,8.3 81.6,8.3
$2N1550: length 4.5
  Top Layer w0.254: 90.4,8.3 89.27,8.3 88.97,8 SW39.1
$2N1551: length 4.6
  Top Layer w0.254: D40.1 97.37,38.3 97.07,38 SW41.1
$2N1552: length 4.3
  Top Layer w0.254: SW42.1 92.77,28 93.07,28.3 D41.1
$2N1553: length 4.6
  Top Layer w0.254: 98.5,18.3 97.37,18.3 97.07,18 SW43.1
$2N1554: length 4.4
  Top Layer w0.254: D43.1 88.37,38.3 88.07,38 SW40.1

## Copper pours and planes (outline as drawn; the poured copper is in the pictures)
VCC on Top Layer: 0.68,92.9 29.63,92.9 31.03,91.51 31.03,51.63 28.61,49.21 2.51,49.21 0.68,51.05
VCC on Bottom Layer: 0.68,92.9 29.63,92.9 31.03,91.51 31.03,51.63 28.61,49.21 2.51,49.21 0.68,51.05

## Text on the board
Top Silkscreen Layer: ESC | Tab
